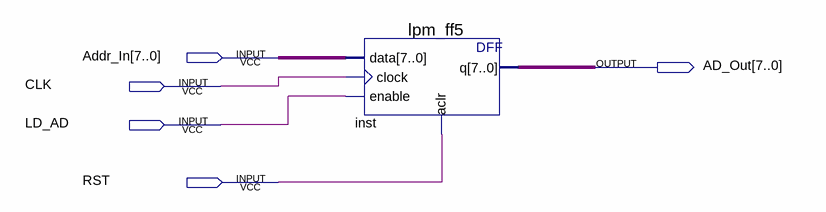
[diagram p0: schematic sheet]
// Quartus schematic AD_cpu_demo.bdf as structural Verilog: 1 symbols, 5 pins
module AD_cpu_demo (
  input  [7:0] Addr_In,
  input  CLK,
  input  LD_AD,
  input  RST,
  output [7:0] AD_Out
);

  lpm_ff5 inst (.data(Addr_In), .clock(CLK), .enable(LD_AD), .aclr(RST), .q(AD_Out));
endmodule
